# Altium schematic sheet AD8139.SchDoc: AD8139
size 410 x 297 mm; ApprovedBy: Кубатко В.А.; CheckedBy: Кубатко В.А.; Author: Сергеев Д.А.; CompanyName: ГК "СНАБЖЕНИЕ"; DrawnBy: Сергеев Д.А.; Engineer: Сергеев Д.А.; Organization: ГК "СНАБЖЕНИЕ"; DocumentNumber: ИЛ1338ТО1/1; Revision: 1; SheetNumber: 3; SheetTotal: 4
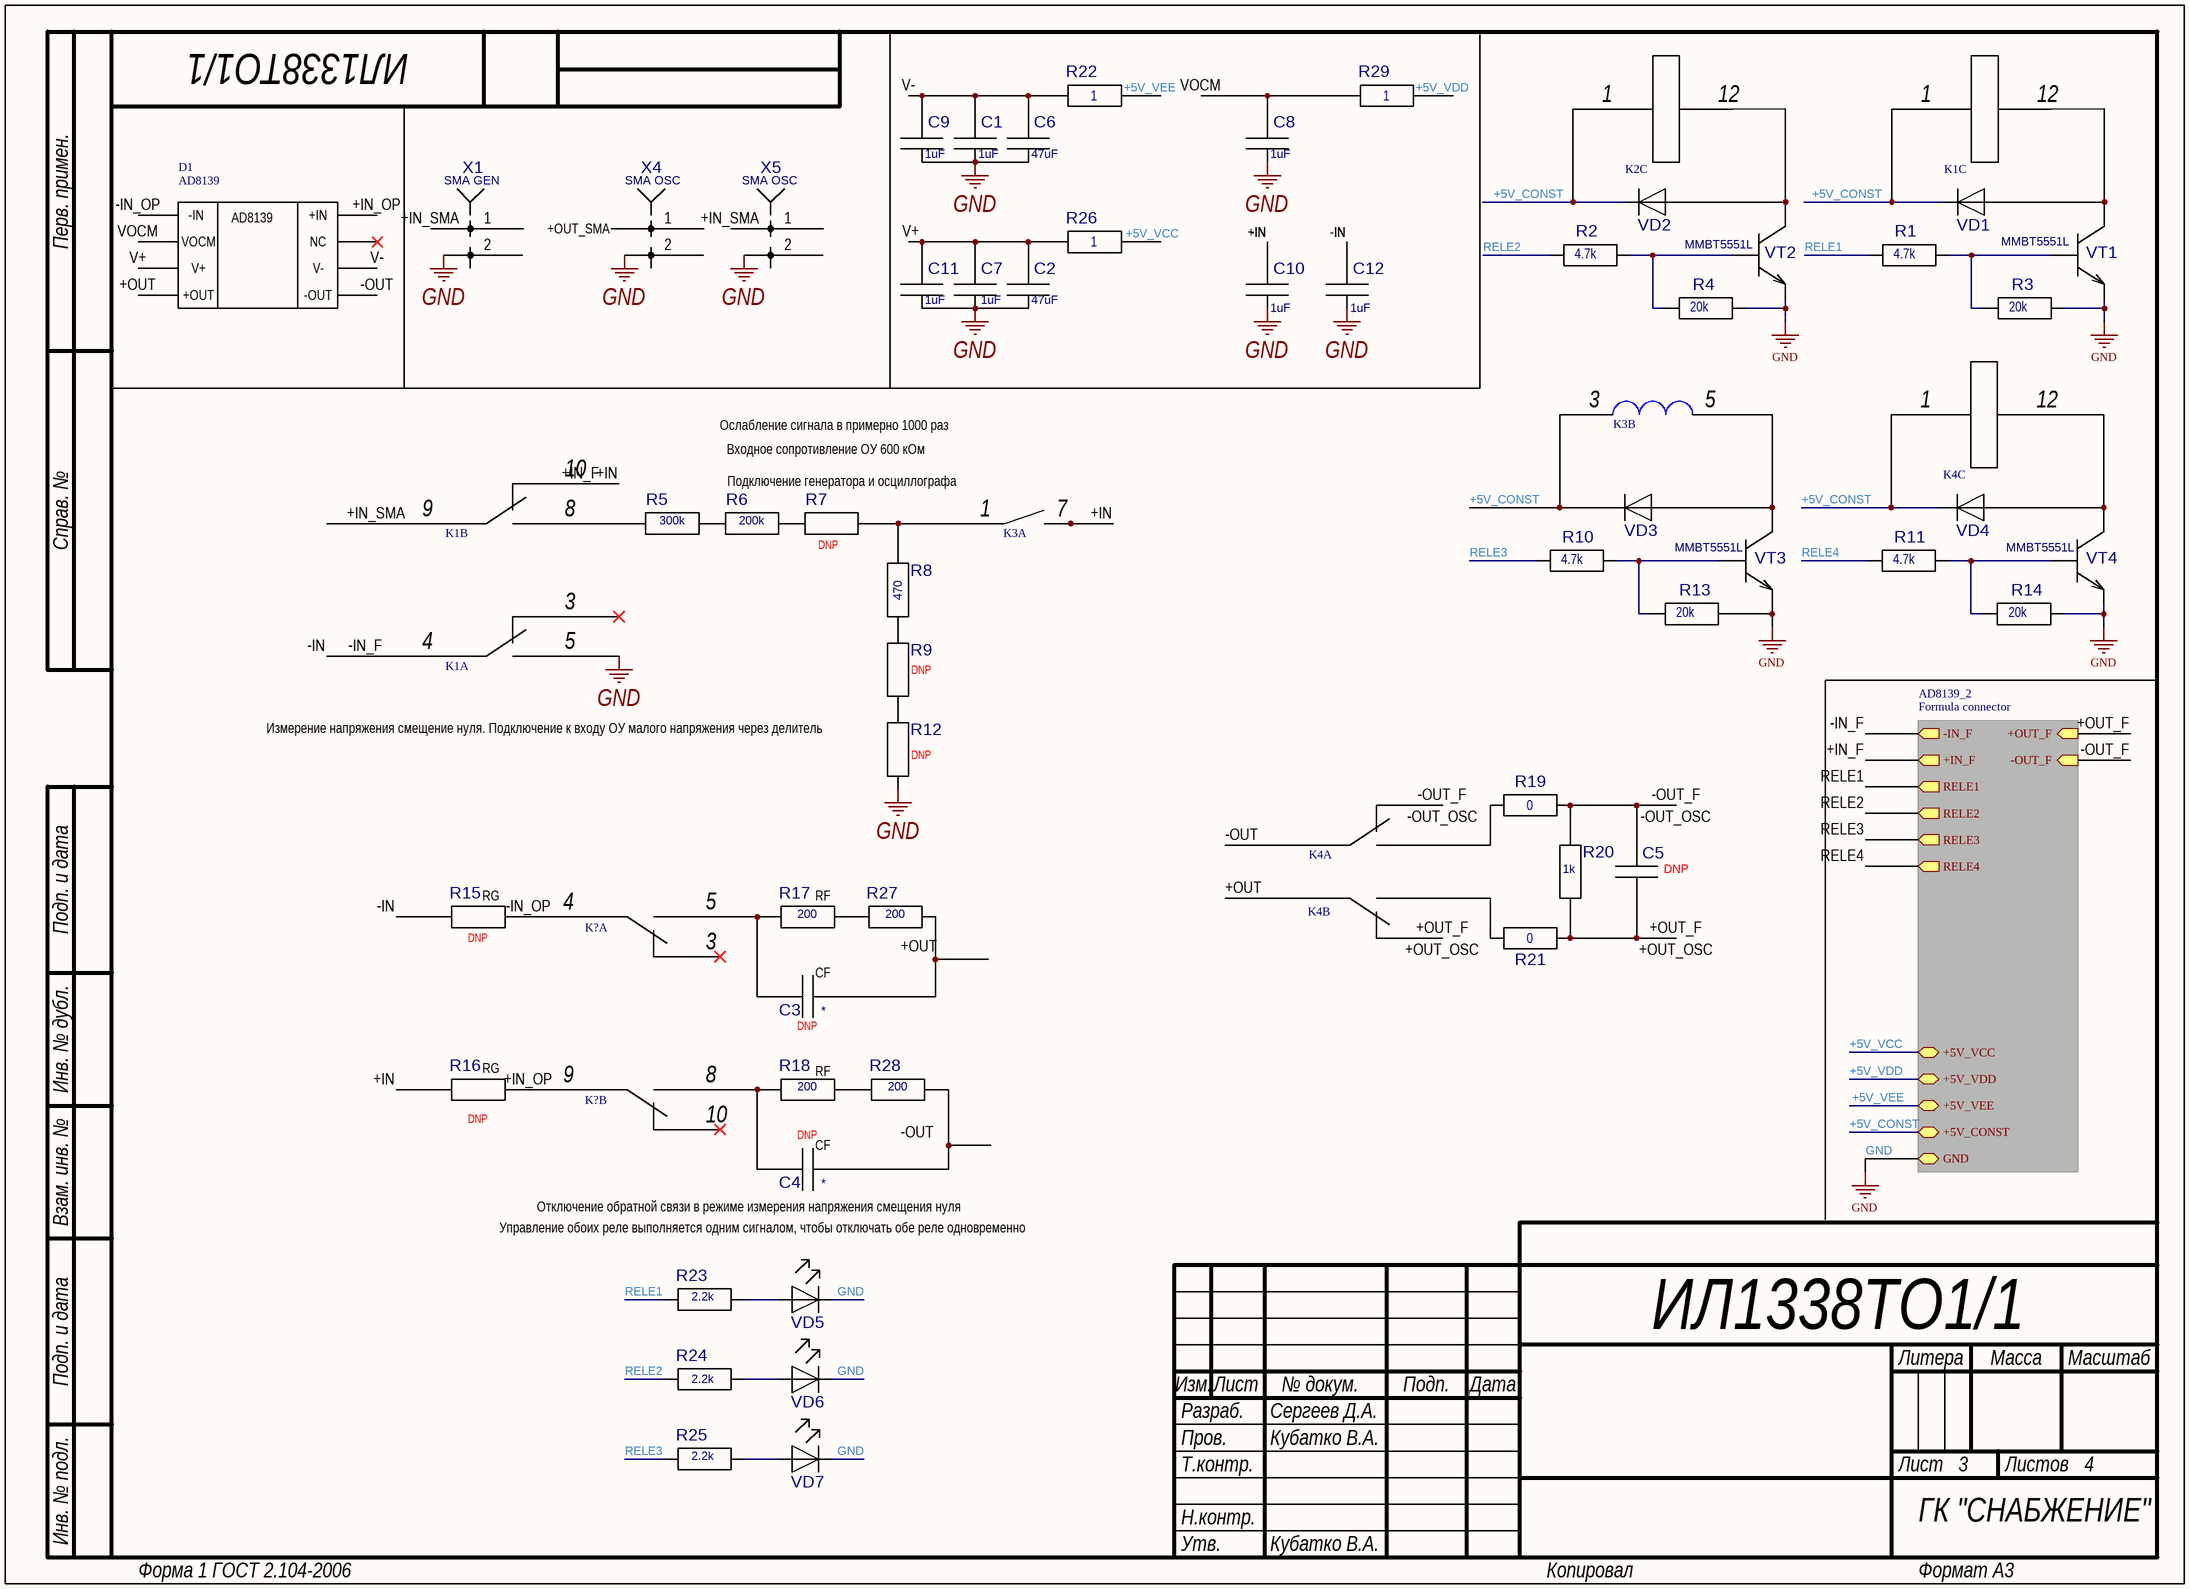
[diagram p0: AD8139.SchDoc]

## Parts
(Parts that share a designator on the sheet are numbered #1, #2 ... from top to bottom, then left to right.)
C1  1uF  [0805]
C2  47uF  [0805]
C3  0.1uF  [0805]  (value not drawn)
C4  0.1uF  [0805]  (value not drawn)
C5  DNP  [0805]
C6  47uF  [0805]
C7  1uF  [0805]
C8  1uF  [0805]
C9  1uF  [0805]
C10  1uF  [0805]
C11  1uF  [0805]
C12  1uF  [0805]
D1  AD8139  [AD8139]
K1  V23079A1001B301 TE  [V23079A1001B301]  (value not drawn)  (parts A,B,C of 3)
K2  V23079A1001B301 TE  [V23079A1001B301]  (value not drawn)  (part C of 3)
K3  TRR1A05F00  [TRR1A05F00]  (value not drawn)  (parts A,B of 2)
K4  V23079A1001B301 TE  [V23079A1001B301]  (value not drawn)  (parts A,B,C of 3)
K?#1  V23079A1001B301 TE  [V23079A1001B301]  (value not drawn)  (part A of 3)
K?#2  V23079A1001B301 TE  [V23079A1001B301]  (value not drawn)  (part B of 3)
R1  4.7k  [0805]
R2  4.7k  [0805]
R3  20k  [0805]
R4  20k  [0805]
R5  300k  [0805]
R6  200k  [0805]
R7  (no value)  [0805]
R8  470  [0805]
R9  (no value)  [0805]
R10  4.7k  [0805]
R11  4.7k  [0805]
R12  (no value)  [0805]
R13  20k  [0805]
R14  20k  [0805]
R15  (no value)  [1206]
R16  (no value)  [1206]
R17  200  [1206]
R18  200  [1206]
R19  0  [0805]
R20  1k  [0805]
R21  0  [0805]
R22  1  [0805]
R23  2.2k  [0805]
R24  2.2k  [0805]
R25  2.2k  [0805]
R26  1  [0805]
R27  200  [1206]
R28  200  [1206]
R29  1  [0805]
VD1  LL4148 NXP  [SOD80C]  (value not drawn)
VD2  LL4148 NXP  [SOD80C]  (value not drawn)
VD3  LL4148 NXP  [SOD80C]  (value not drawn)
VD4  LL4148 NXP  [SOD80C]  (value not drawn)
VD5  LED(0805)  [0805(LED)]  (value not drawn)
VD6  LED(0805)  [0805(LED)]  (value not drawn)
VD7  LED(0805)  [0805(LED)]  (value not drawn)
VT1  MMBT5551L  [SOT-23]
VT2  MMBT5551L  [SOT-23]
VT3  MMBT5551L  [SOT-23]
VT4  MMBT5551L  [SOT-23]
X1  SMA GEN  [KLS1-SMA002-B]
X4  SMA OSC  [KLS1-SMA002-B]
X5  SMA OSC  [KLS1-SMA002-B]

## Sub-sheets
Formula connector = AD8139_2: RELE1 (out), RELE2 (out), RELE3 (out), +5V_VCC (bidir), +5V_VEE (bidir), GND (bidir), +5V_CONST (bidir), +5V_VDD (bidir), +IN_F (out), -IN_F (out), +OUT_F (in), -OUT_F (in), RELE4 (out)

## Nets
GND: C1.2 C2.2 C6.2 C7.2 C8.2 C9.2 C10.2 C11.2 C12.2 K1.5 R3.2 R4.2 R12.1 R13.2 R14.2 VD5.2(K) VD6.2(K) VD7.2(K) VT1.2(E) VT2.2(E) VT3.2(E) VT4.2(E) X1.2 X4.2 X5.2 ; sheet Formula connector/GND
+5V_CONST: K1.1 K2.1 K3.3 K4.1 VD1.2(K) VD2.2(K) VD3.2(K) VD4.2(K) ; sheet Formula connector/+5V_CONST
+5V_VCC: R26.2 ; sheet Formula connector/+5V_VCC
+5V_VDD: R29.2 ; sheet Formula connector/+5V_VDD
+5V_VEE: R22.2 ; sheet Formula connector/+5V_VEE
+IN: C10.1 C12.1 K1.4 K1.10 K3.7 R15.1 R16.1 ; sheet Formula connector/+IN_F, sheet Formula connector/-IN_F  [also labelled +IN_F, -IN, -IN_F]
+IN_OP: D1.8 K?#2.9 R16.2
+IN_SMA: K1.9 X1.1 X5.1
+OUT: D1.4 K4.9
+OUT_F: C5.1 K4.10 R20.1 R21.2 ; sheet Formula connector/+OUT_F  [also labelled +OUT_OSC]
+OUT_SMA: X4.1
-IN_OP: D1.1 K?#1.4 R15.2
-OUT: D1.5 K4.4
-OUT_F: C5.2 K4.3 R19.2 R20.2 ; sheet Formula connector/-OUT_F  [also labelled -OUT_OSC]
RELE1: R1.1 R23.1 ; sheet Formula connector/RELE1
RELE2: R2.1 R24.1 ; sheet Formula connector/RELE2
RELE3: R10.1 R25.1 ; sheet Formula connector/RELE3
RELE4: R11.1 ; sheet Formula connector/RELE4
V+: C2.1 C7.1 C11.1 D1.3 R26.1
V-: C1.1 C6.1 C9.1 D1.6 R22.1
VOCM: C8.1 D1.2 R29.1
NetC3_1: C3.1 K?#1.5 R17.1
NetC3_2: C3.2 R27.2
NetC4_1: C4.1 K?#2.8 R18.1
NetC4_2: C4.2 R28.2
NetK1_8: K1.8 R5.1
NetK1_12: K1.12 VD1.1(A) VT1.3(K)
NetK2_12: K2.12 VD2.1(A) VT2.3(K)
NetK3_1: K3.1 R7.2 R8.2
NetK3_5: K3.5 VD3.1(A) VT3.3(K)
NetK4_5: K4.5 R19.1
NetK4_8: K4.8 R21.1
NetK4_12: K4.12 VD4.1(A) VT4.3(K)
NetR1_2: R1.2 R3.1 VT1.1(B)
NetR2_2: R2.2 R4.1 VT2.1(B)
NetR5_2: R5.2 R6.1
NetR6_2: R6.2 R7.1
NetR8_1: R8.1 R9.2
NetR9_1: R9.1 R12.2
NetR10_2: R10.2 R13.1 VT3.1(B)
NetR11_2: R11.2 R14.1 VT4.1(B)
NetR17_2: R17.2 R27.1
NetR18_2: R18.2 R28.1
NetR23_2: R23.2 VD5.1(A)
NetR24_2: R24.2 VD6.1(A)
NetR25_2: R25.2 VD7.1(A)

Not connected (* = marked no-connect by the designer): D1 7*; K1 3*; K?#1 3*; K?#2 10*

## Notes on the sheet
- Входное сопротивление ОУ 600 кОм
- Ослабление сигнала в примерно 1000 раз
- Подключение генератора и осциллографа
- (near R7) DNP
- (near R9) DNP
- Измерение напряжения смещение нуля. Подключение к входу ОУ малого напряжения через делитель
- (near R12) DNP
- (near R15) DNP
- (near R15) RG
- (near R17) RF
- (near C3) CF
- (near R16) RG
- (near C3) DNP
- (near R18) RF
- (near R16) DNP
- DNP
- (near C4) Отключение обратной связи в режиме измерения напряжения смещения нуля
- (near C4) CF
- Управление обоих реле выполняется одним сигналом, чтобы отключать обе реле одновременно
- Labels drawn without touching a wire or pin: +OUT, -OUT
- Перв. примен.
- Справ. №
- Подп. и дата
- Инв. № дубл.
- Взам. инв. №
- Разраб.
- Изм.
- Лист
- № докум.
- Подп.
- Дата
- Литера
- Масса
- Масштаб
- Пров.
- Т.контр.
- Листов
- Инв. № подл.
- Н.контр.
- Утв.
- Форма 1 ГОСТ 2.104-2006
- Копировал
- Формат А3
- (in symbol AD8139) -IN; +IN; VOCM; NC; V+; V-; +OUT; -OUT

## Library data of the parts
C1-C12 = C0805: ComponentHeigt: 1.3; Firme: AVX; Leadform: SMD; KIND: Конденсатор; ClassName: *; Component Link: *; ComponentWeigt: *; Packaging: 0805; NN: *
  C3 C4: Value: *
R1-R4 R10 R11 R13 R14 R19-R26 R29 = R0805 Yageo: ComponentHeigt: 0.6; Firme: Yageo; Leadform: SMD; Kind: Резистор; ClassName: *; ComponentWeigt: *; Component Link: *; Packaging: 0805; NN: *
  R1 R2 R10 R11: Value: 4.7k
  R3 R4 R13 R14: Value: 20k
  R19 R21: Value: 0
  R22 R26 R29: Value: 1
  R23-R25: Value: *
R5-R9 R12 = R0805 Yageo: ComponentHeigt: 0.6; Leadform: SMD; Kind: Резистор; ClassName: *; ComponentWeigt: *; Component Link: *; Firme: Yageo; Packaging: 0805; NN: *; Value: *
R15-R18 R27 R28 = R1206 Yageo: R1206 Yageo 200 Ohm ±0.1%; ComponentHeigt: 0.6; Leadform: SMD; Kind: Резистор; ClassName: *; ComponentWeigt: *; Component Link: *; Firme: Yageo; Packaging: 0805; NN: *; Value: *
VD1-VD4 = LL4148 NXP: ComponentHeigt: 1.6; Leadform: SMD; NN: 24009301; KIND: Диод LL4148 NXP; Component Link: http://www.nxp.com; Packaging: SOD-80C; ClassName: *; Firme: NXP
VD5-VD7 = LED(0805): ComponentHeigt: 0.75; Leadform: в отверстия; Firme: Kingbright; NN: 24003000; KIND: Светодиод L-1154GD Kingbright; Component Link: *; ClassName: *
VT1-VT4 = MMBT5551L: ComponentHeigt: 1.1; Firme: ONS; Leadform: SMD; NN: 24007468; KIND: Транзистор MMBT5551L*G ONS; ClassName: *; ComponentWeigt: *; Packaging: SOT-23
X1 X4 X5 = KLS1-SMA002-B: ComponentHeigt: 5.5; Name: Вилка; Specification: Вилка PLD2-2 *; Typ: PLD2-2; ClassName: *; Component Link: *; ComponentWeigt: *; Firme: *; Leadform: *; NN: *; KIND: *